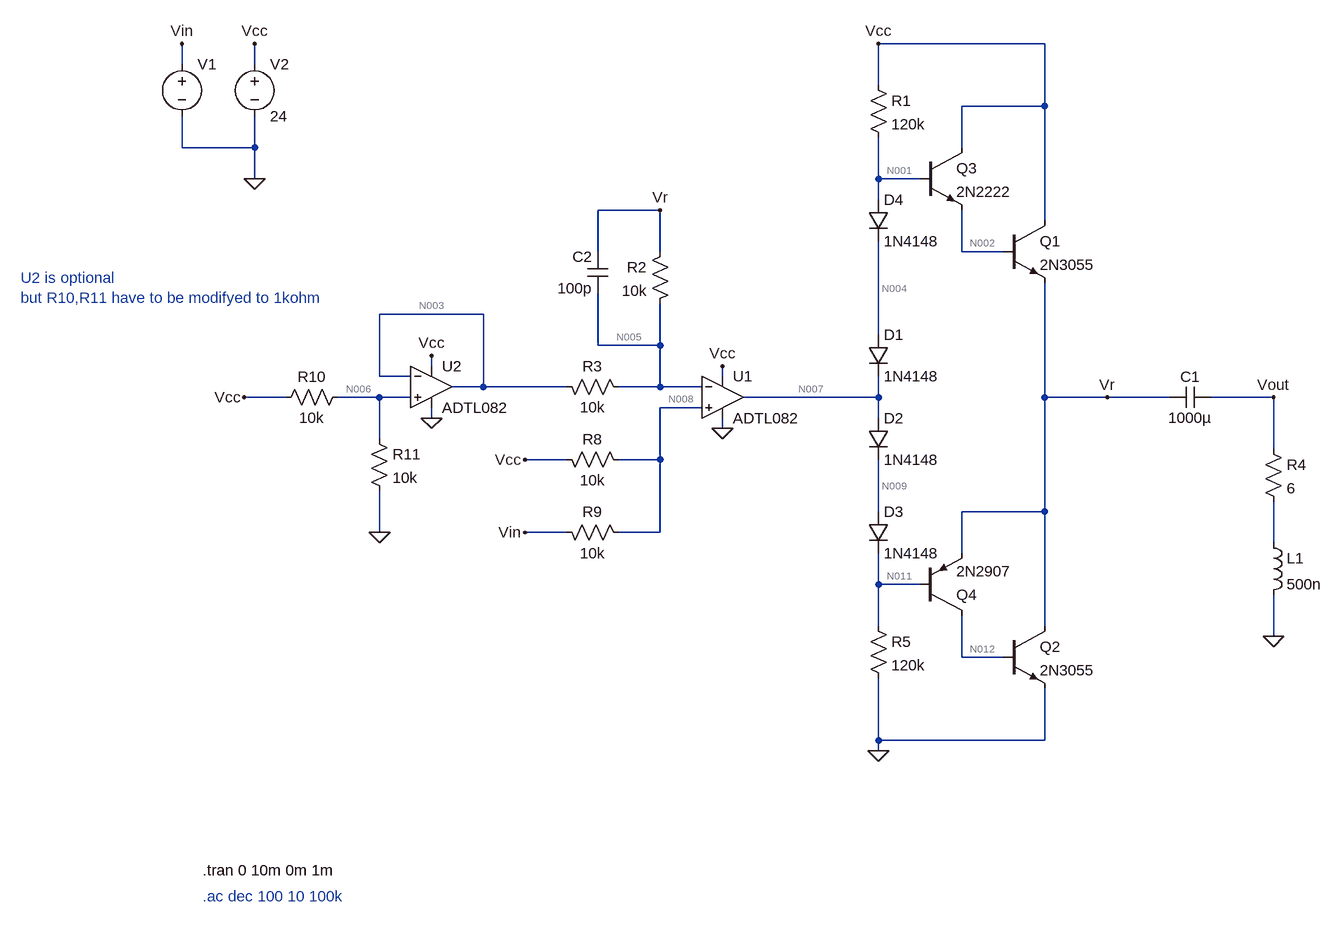
[diagram p0: schematic AB amplifier v1.asc]
AB amplifier v1.asc, the LTspice schematic file:
Version 4.1
SHEET 1 880 848
WIRE 304 -480 48 -480
WIRE -1024 -448 -1024 -480
WIRE -912 -448 -912 -480
WIRE 48 -416 48 -480
WIRE 304 -384 304 -480
WIRE 304 -384 176 -384
WIRE -1024 -320 -1024 -368
WIRE -912 -320 -912 -368
WIRE -912 -320 -1024 -320
WIRE 176 -320 176 -384
WIRE -912 -272 -912 -320
WIRE 48 -272 48 -336
WIRE 112 -272 48 -272
WIRE 48 -240 48 -272
WIRE -288 -224 -384 -224
WIRE 304 -208 304 -384
WIRE -384 -160 -384 -224
WIRE -288 -160 -288 -224
WIRE 176 -160 176 -224
WIRE 240 -160 176 -160
WIRE -560 -64 -720 -64
WIRE 48 -32 48 -176
WIRE -384 -16 -384 -96
WIRE -288 -16 -288 -80
WIRE -288 -16 -384 -16
WIRE -640 16 -640 0
WIRE -720 32 -720 -64
WIRE -672 32 -720 32
WIRE -192 32 -192 16
WIRE -560 48 -560 -64
WIRE -560 48 -608 48
WIRE -432 48 -560 48
WIRE -288 48 -288 -16
WIRE -288 48 -352 48
WIRE -224 48 -288 48
WIRE -864 64 -928 64
WIRE -720 64 -784 64
WIRE -672 64 -720 64
WIRE 48 64 48 32
WIRE 48 64 -160 64
WIRE 304 64 304 -112
WIRE 400 64 304 64
WIRE 496 64 400 64
WIRE 656 64 560 64
WIRE -224 80 -288 80
WIRE -640 96 -640 80
WIRE 48 96 48 64
WIRE -192 112 -192 96
WIRE -720 128 -720 64
WIRE 656 144 656 64
WIRE -432 160 -496 160
WIRE -288 160 -288 80
WIRE -288 160 -352 160
WIRE 48 240 48 160
WIRE 304 240 304 64
WIRE 304 240 176 240
WIRE -720 272 -720 208
WIRE -432 272 -496 272
WIRE -288 272 -288 160
WIRE -288 272 -352 272
WIRE 656 288 656 224
WIRE 176 304 176 240
WIRE 48 352 48 304
WIRE 112 352 48 352
WIRE 48 416 48 352
WIRE 304 416 304 240
WIRE 656 432 656 368
WIRE 176 464 176 400
WIRE 240 464 176 464
WIRE 48 592 48 496
WIRE 304 592 304 512
WIRE 304 592 48 592
WIRE 48 608 48 592
FLAG 48 -480 Vcc
FLAG -192 16 Vcc
FLAG -288 -224 Vr
FLAG -912 -480 Vcc
FLAG 656 64 Vout
FLAG -192 112 0
FLAG 48 608 0
FLAG 656 432 0
FLAG -496 160 Vcc
FLAG -912 -272 0
FLAG -496 272 Vin
FLAG -640 0 Vcc
FLAG -640 96 0
FLAG -720 272 0
FLAG -928 64 Vcc
FLAG -1024 -480 Vin
FLAG 400 64 Vr
SYMBOL npn 240 -208 R0
SYMATTR InstName Q1
SYMATTR Value 2N3055
SYMBOL npn 240 416 R0
SYMATTR InstName Q2
SYMATTR Value 2N3055
SYMBOL npn 112 -320 R0
SYMATTR InstName Q3
SYMATTR Value 2N2222
SYMBOL pnp 112 400 M180
SYMATTR InstName Q4
SYMATTR Value 2N2907
SYMBOL res 32 -432 R0
SYMATTR InstName R1
SYMATTR Value 120k
SYMBOL diode 32 -32 R0
SYMATTR InstName D1
SYMATTR Value 1N4148
SYMBOL diode 32 96 R0
SYMATTR InstName D2
SYMATTR Value 1N4148
SYMBOL diode 32 240 R0
SYMATTR InstName D3
SYMATTR Value 1N4148
SYMBOL OpAmps\\ADTL082 -192 0 R0
SYMATTR InstName U1
SYMBOL res -272 -176 M0
SYMATTR InstName R2
SYMATTR Value 10k
SYMBOL res -448 32 M90
WINDOW 0 0 56 VBottom 2
WINDOW 3 32 56 VTop 2
SYMATTR InstName R3
SYMATTR Value 10k
SYMBOL res 640 128 R0
SYMATTR InstName R4
SYMATTR Value 6
SYMBOL ind 640 272 R0
SYMATTR InstName L1
SYMATTR Value 500n
SYMBOL voltage -1024 -464 R0
WINDOW 3 24 96 Invisible 2
WINDOW 39 0 0 Left 0
SYMATTR InstName V1
SYMATTR Value SINE(0 2 1k)
SYMATTR Value2 AC 1 0
SYMBOL voltage -912 -464 R0
WINDOW 123 0 0 Left 0
WINDOW 39 0 0 Left 0
SYMATTR InstName V2
SYMATTR Value 24
SYMBOL res 32 400 R0
SYMATTR InstName R5
SYMATTR Value 120k
SYMBOL diode 32 -240 R0
SYMATTR InstName D4
SYMATTR Value 1N4148
SYMBOL cap 560 48 R90
WINDOW 0 0 32 VBottom 2
WINDOW 3 32 32 VTop 2
SYMATTR InstName C1
SYMATTR Value 1000µ
SYMBOL res -336 176 M270
WINDOW 0 32 56 VTop 2
WINDOW 3 0 56 VBottom 2
SYMATTR InstName R8
SYMATTR Value 10k
SYMBOL res -336 288 M270
WINDOW 0 32 56 VTop 2
WINDOW 3 0 56 VBottom 2
SYMATTR InstName R9
SYMATTR Value 10k
SYMBOL OpAmps\\ADTL082 -640 -16 R0
SYMATTR InstName U2
SYMBOL res -768 48 R90
WINDOW 0 0 56 VBottom 2
WINDOW 3 32 56 VTop 2
SYMATTR InstName R10
SYMATTR Value 10k
SYMBOL res -736 112 R0
SYMATTR InstName R11
SYMATTR Value 10k
SYMBOL cap -368 -160 M0
SYMATTR InstName C2
SYMATTR Value 100p
TEXT -992 792 Left 2 !.tran 0 10m 0m 1m
TEXT -1272 -120 Left 2 ;U2 is optional\nbut R10,R11 have to be modifyed to 1kohm
TEXT -992 832 Left 2 ;.ac dec 100 10 100k

The netlist it stands for:
* AB amplifier v1.asc
Q1 Vcc N002 Vr 0 2N3055
Q2 Vr N012 0 0 2N3055
Q3 Vcc N001 N002 0 2N2222
Q4 N012 N011 Vr 0 2N2907
R1 Vcc N001 120k
D1 N004 N007 1N4148
D2 N007 N009 1N4148
D3 N009 N011 1N4148
X§U1 N008 N005 Vcc 0 N007 ADTL082  ; pins In+ In- V+ V- OUT
R2 Vr N005 10k
R3 N003 N005 10k
R4 Vout N010 6
L1 N010 0 500n
V1 Vin 0 SINE(0 2 1k) AC 1 0
V2 Vcc 0 24
R5 N011 0 120k
D4 N001 N004 1N4148
C1 Vout Vr 1000µ
R8 N008 Vcc 10k
R9 N008 Vin 10k
X§U2 N006 N003 Vcc 0 N003 ADTL082  ; pins In+ In- V+ V- OUT
R10 N006 Vcc 10k
R11 N006 0 10k
C2 Vr N005 100p
.model D D
.lib standard.dio
.model NPN NPN
.model PNP PNP
.lib standard.bjt
.tran 0 10m 0m 1m
* U2 is optional
* but R10,R11 have to be modifyed to 1kohm
* .ac dec 100 10 100k
.lib ADI.lib
.backanno
.end

* Results of the author's LTspice run, read from the files saved beside the schematic
* Operating Point, zero values left out:
*   V(n002) = 12.44 V
*   V(n012) = 439.5 mV
*   V(n001) = 13.14 V
*   V(n004) = 12.68 V
*   V(n008) = 12 V
*   V(n003) = 12 V
*   V(vcc) = 24 V
*   V(vr) = 12 V
*   V(n011) = 11.3 V
*   V(n007) = 12.23 V
*   V(n009) = 11.76 V
*   V(n005) = 12 V
*   V(n006) = 12 V
*   Ic(Q1) = 342.9 mA
*   Ib(Q1) = 6.308 mA
*   Ie(Q1) = -349.2 mA
*   I(D3) = 70.56 µA
*   I(R2) = -31.68 pA
*   I(R3) = 33.68 pA
*   I(R5) = 94.15 µA
*   I(R11) = 1.2 mA
*   Ic(Q3) = 6.28 mA
*   Ib(Q3) = 28.86 µA
*   Ie(Q3) = -6.308 mA
*   I(R1) = 90.49 µA
*   I(D1) = 61.63 µA
*   I(V2) = -361.8 mA
*   Ic(Q2) = 342.9 mA
*   Ib(Q2) = 6.308 mA
*   Ie(Q2) = -349.2 mA
*   I(V1) = 1.2 mA
*   I(D4) = 61.63 µA
*   I(R8) = -1.2 mA
*   I(R9) = 1.2 mA
*   I(R10) = -1.2 mA
*   Ic(Q4) = -6.308 mA
*   Ib(Q4) = -23.58 µA
*   Ie(Q4) = 6.331 mA
*   I(D2) = 70.56 µA
*   Ix(u2:1) = 2 pA
*   Ix(u2:2) = 2 pA
*   Ix(u2:3) = 5.055 mA
*   Ix(u2:4) = -5.055 mA
*   Ix(u2:5) = -35.68 pA
*   Ix(u1:1) = 2 pA
*   Ix(u1:2) = 2 pA
*   Ix(u1:3) = 5.06 mA
*   Ix(u1:4) = -5.051 mA
*   Ix(u1:5) = -8.932 µA
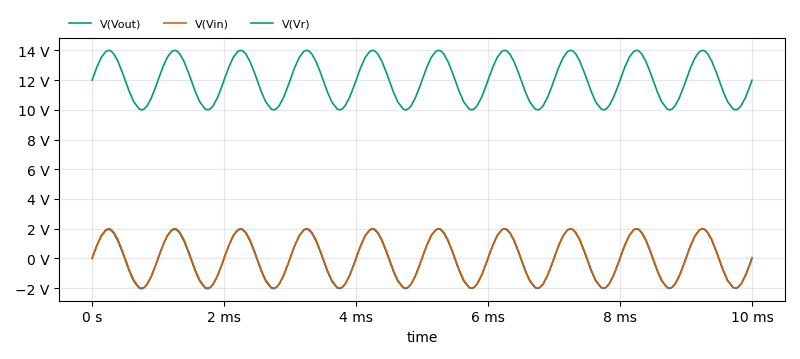
[diagram p1: Transient Analysis of AB amplifier v1.asc, plotted from the saved traces]
* Transient Analysis, 1 run:
*   V(Vout): min -2.045 V, max 1.987 V, average -25.11 mV, rms 1.415 V, last 34.81 mV
*   V(Vin): min -2 V, max 2 V, average 803.5 µV, rms 1.417 V, last 0 V
*   V(Vr): min 10 V, max 14 V, average 12 V, rms 12.08 V, last 11.99 V